# Altium project Main-Board-V1.1.PrjPcb (part 3 of 3)
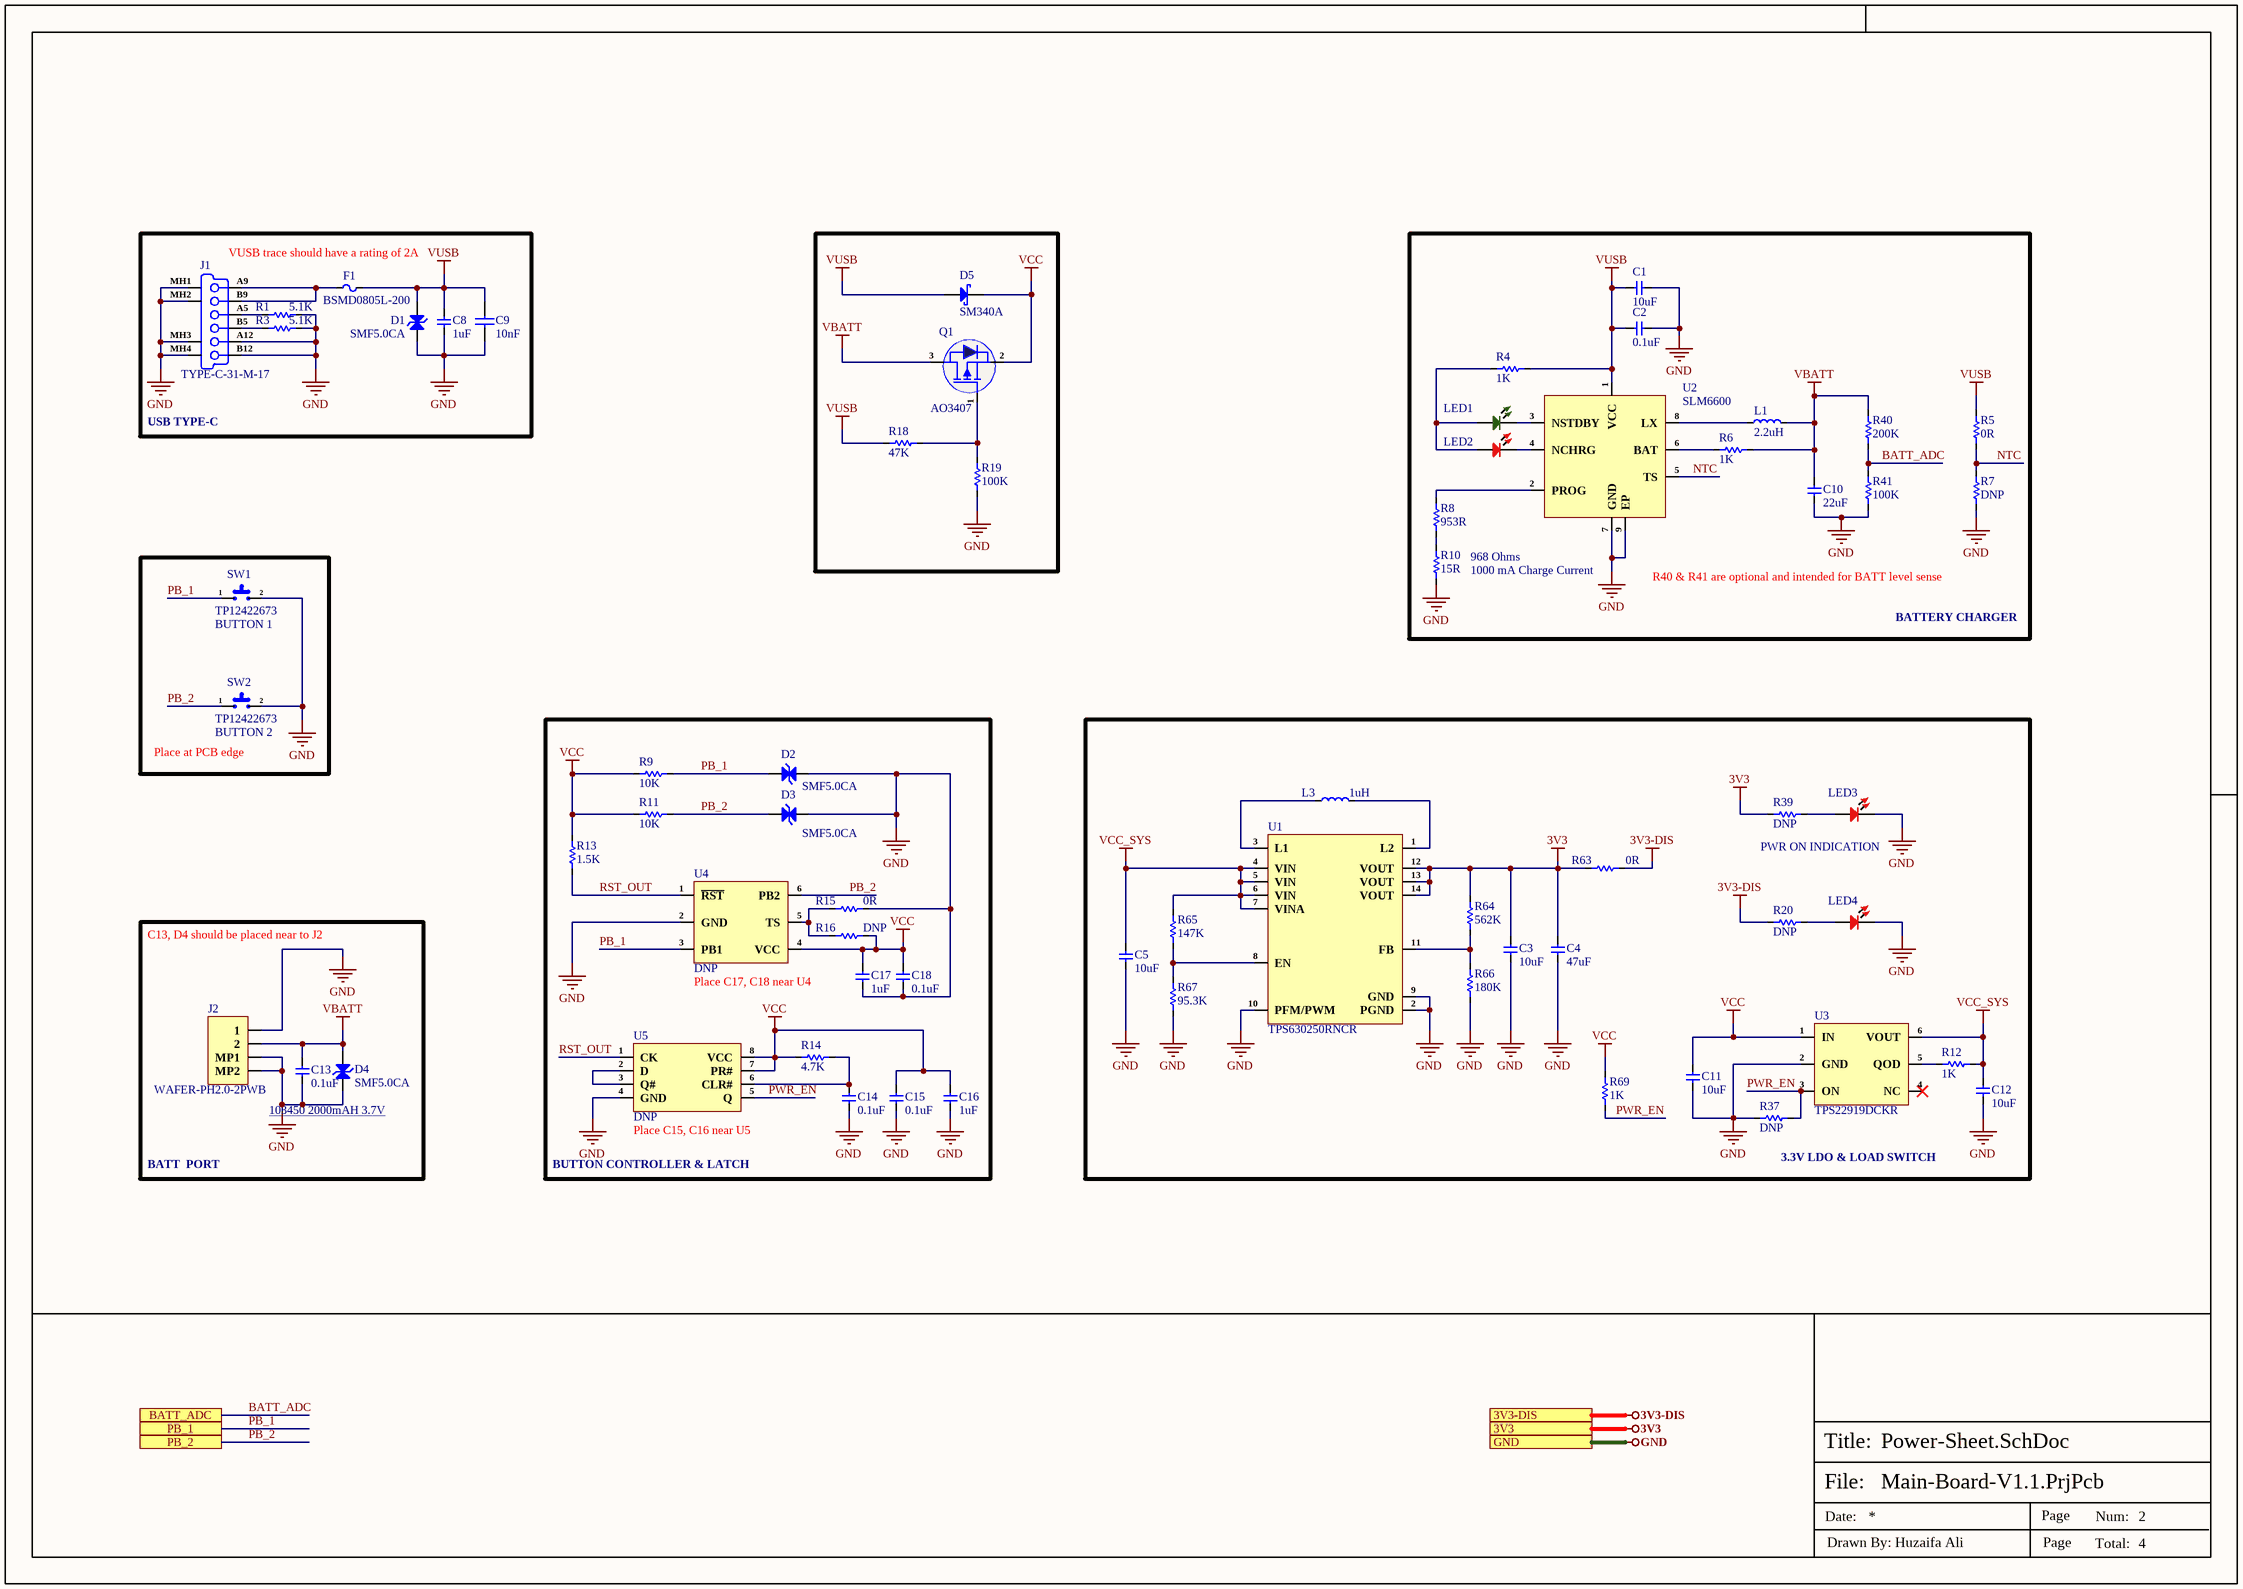
[diagram p5: Power-Sheet.SchDoc]

## Sheet Power-Sheet.SchDoc (continued)

### Library data of the parts (continued)
U3 = TPS22919DCKR: 5.5V 1.5A 90mΩ Controlled Rise Time Self-Protecting Load Switch; Manufacturer: Texas Instruments; Item Type: IC; Fall Time: 10us; Min Supply Voltage: 1.6V; Nominal Supply Current: 8uA; Number of Drivers: 1NUMBER; Rise Time: 750us; Turn-Off Delay Time: 6us; Turn-On Delay Time: 1.5ms; Supplier: Digikey; LCSC Part Number: C2149796; Manufacturer Part Number: TPS22919DCKR; RoHS: Yes; Stock: 134665; Pricing: 1=0.18, 10=0.122, 25=0.1072, 100=0.0911, 250=0.08344, 500=0.07882, 1000=0.07503 (USD); Pins: 6NUMBER; Max Supply Voltage: 5.5V; Output Current: 1.5A; Length: 2mm; Width: 1.25mm; Height: 1.1mm; Thickness: 900um; ComponentLink1URL: http://www.ti.com/general/docs/suppproductinfo.tsp?distId=10&amp;gotoUrl=http%3A%2F%2Fwww.ti.com%2Flit%2Fgpn%2Ftps22919&src-supplier=Digikey; ComponentLink1Description: http://www.ti.com/general/docs/suppproductinfo.tsp?distId=10&amp;gotoUrl=http%3A%2F%2Fwww.ti.com%2Flit%2Fgpn%2Ftps22919&src-supplier=Digikey
U4 = TPS3421EGDRYR: IC SUPERVISOR 2 CHANNEL 6SON; Manufacturer: Texas Instruments; Supplier: Digikey; LCSC Part Number: C361167; Manufacturer Part Number: TPS3421EGDRYR; RoHS: Yes; Item Type: IC; Stock: 11931; Pricing: 1=1.12, 10=0.811, 25=0.7332, 100=0.6475, 250=0.6066, 500=0.58194, 1000=0.56164, 2500=0.5402 (USD); ComponentLink1URL: http://components.arrow.com/part/dataview/56191445S506834N7713?src-supplier=Arrow+Electronics; ComponentLink1Description: http://components.arrow.com/part/dataview/56191445S506834N7713?src-supplier=Arrow+Electronics; ComponentLink2URL: http://www.ti.com/lit/gpn/tps3421?src-supplier=Mouser; ComponentLink2Description: http://www.ti.com/lit/gpn/tps3421?src-supplier=Mouser; ComponentLink3URL: http://www.ti.com/lit/ds/symlink/tps3420.pdf?src-supplier=Digikey; ComponentLink3Description: http://www.ti.com/lit/ds/symlink/tps3420.pdf?src-supplier=Digikey; ComponentLink4URL: http://www.ti.com/general/docs/suppproductinfo.tsp?distId=10&amp;gotoUrl=http%3A%2F%2Fwww.ti.com%2Flit%2Fgpn%2Ftps3420&src-supplier=Digikey; ComponentLink4Description: http://www.ti.com/general/docs/suppproductinfo.tsp?distId=10&amp;gotoUrl=http%3A%2F%2Fwww.ti.com%2Flit%2Fgpn%2Ftps3420&src-supplier=Digikey; ComponentLink5URL: http://www.ti.com/general/docs/lit/getliterature.tsp?genericPartNumber=TPS3422&&fileType=pdf&src-supplier=Avnet; ComponentLink5Description: http://www.ti.com/general/docs/lit/getliterature.tsp?genericPartNumber=TPS3422&&fileType=pdf&src-supplier=Avnet
U5 = NC7SZ74K8X: IC FF D-TYPE SNGL 1BIT US8; Manufacturer: ON Semiconductor / Fairchild; Number of Channels: 1NUMBER; Number of Outputs: 2NUMBER; Supplier: Digikey; LCSC Part Number: C128370; Manufacturer Part Number: NC7SZ74K8X; RoHS: Yes; Item Type: IC; Stock: 98; Pricing: 1=0.71, 10=0.427, 25=0.352, 100=0.2668, 250=0.22504, 500=0.1993, 1000=0.17774 (USD); Number of Inputs: 1NUMBER; Lead Free: 5697LeadFree; ComponentLink1URL: https://datasheet.ciiva.com/34301/1022228-34301883.pdf?src-supplier=Jameco; ComponentLink1Description: https://datasheet.ciiva.com/34301/1022228-34301883.pdf?src-supplier=Jameco; ComponentLink2URL: https://datasheet.ciiva.com/15091/getdatasheetpartid-93111-15091349.pdf?src-supplier=Verical; ComponentLink2Description: https://datasheet.ciiva.com/15091/getdatasheetpartid-93111-15091349.pdf?src-supplier=Verical; ComponentLink3URL: https://datasheet.ciiva.com/5701/1727525-5701664.pdf?src-supplier=Farnell; ComponentLink3Description: https://datasheet.ciiva.com/5701/1727525-5701664.pdf?src-supplier=Farnell; ComponentLink4URL: https://datasheet.ciiva.com/8250/nc7sz74-8250464.pdf?src-supplier=Avnet; ComponentLink4Description: https://datasheet.ciiva.com/8250/nc7sz74-8250464.pdf?src-supplier=Avnet; ComponentLink5URL: https://datasheet.ciiva.com/4812/nc7sz74-116462-4812418.pdf?src-supplier=Mouser; ComponentLink5Description: https://datasheet.ciiva.com/4812/nc7sz74-116462-4812418.pdf?src-supplier=Mouser; ComponentLink6URL: https://datasheet.ciiva.com/1856/nc7sz74-1856933.pdf?src-supplier=Digikey; ComponentLink6Description: https://datasheet.ciiva.com/1856/nc7sz74-1856933.pdf?src-supplier=Digikey; ComponentLink7URL: https://datasheet.ciiva.com/1856/nc7sz74-1856934.pdf?src-supplier=Digikey; ComponentLink7Description: https://datasheet.ciiva.com/1856/nc7sz74-1856934.pdf?src-supplier=Digikey; ComponentLink8URL: https://datasheet.ciiva.com/1856/nc7sz74-1856935.pdf?src-supplier=Digikey; ComponentLink8Description: https://datasheet.ciiva.com/1856/nc7sz74-1856935.pdf?src-supplier=Digikey; ComponentLink9URL: https://datasheet.ciiva.com/28416/1727525-28416494.pdf?src-supplier=Element14; ComponentLink9Description: https://datasheet.ciiva.com/28416/1727525-28416494.pdf?src-supplier=Element14; ComponentLink10URL: https://datasheet.ciiva.com/7970/1727525-7970733.pdf?src-supplier=Element14; ComponentLink10Description: https://datasheet.ciiva.com/7970/1727525-7970733.pdf?src-supplier=Element14; ComponentLink11URL: https://datasheet.ciiva.com/7970/1727525-7970734.pdf?src-supplier=Element14; ComponentLink11Description: https://datasheet.ciiva.com/7970/1727525-7970734.pdf?src-supplier=Element14; ComponentLink12URL: https://datasheet.ciiva.com/7970/1727525-7970735.pdf?src-supplier=Element14; ComponentLink12Description: https://datasheet.ciiva.com/7970/1727525-7970735.pdf?src-supplier=Element14; ComponentLink13URL: https://datasheet.ciiva.com/16740/nc7sz74-16740983.pdf?src-supplier=Future+Electronics; ComponentLink13Description: https://datasheet.ciiva.com/16740/nc7sz74-16740983.pdf?src-supplier=Future+Electronics; ComponentLink14URL: https://datasheet.ciiva.com/48704/001253503-da-01-en-ic-d-type-pos-trg-nc7sz74k8x-vfsop-8-fsc-48704778.pdf?src-supplier=Conrad; ComponentLink14Description: https://datasheet.ciiva.com/48704/001253503-da-01-en-ic-d-type-pos-trg-nc7sz74k8x-vfsop-8-fsc-48704778.pdf?src-supplier=Conrad

## Sheet Screen-Controller-Sheet.SchDoc
size 420 x 297 mm; SheetNumber: 4; SheetTotal: 4
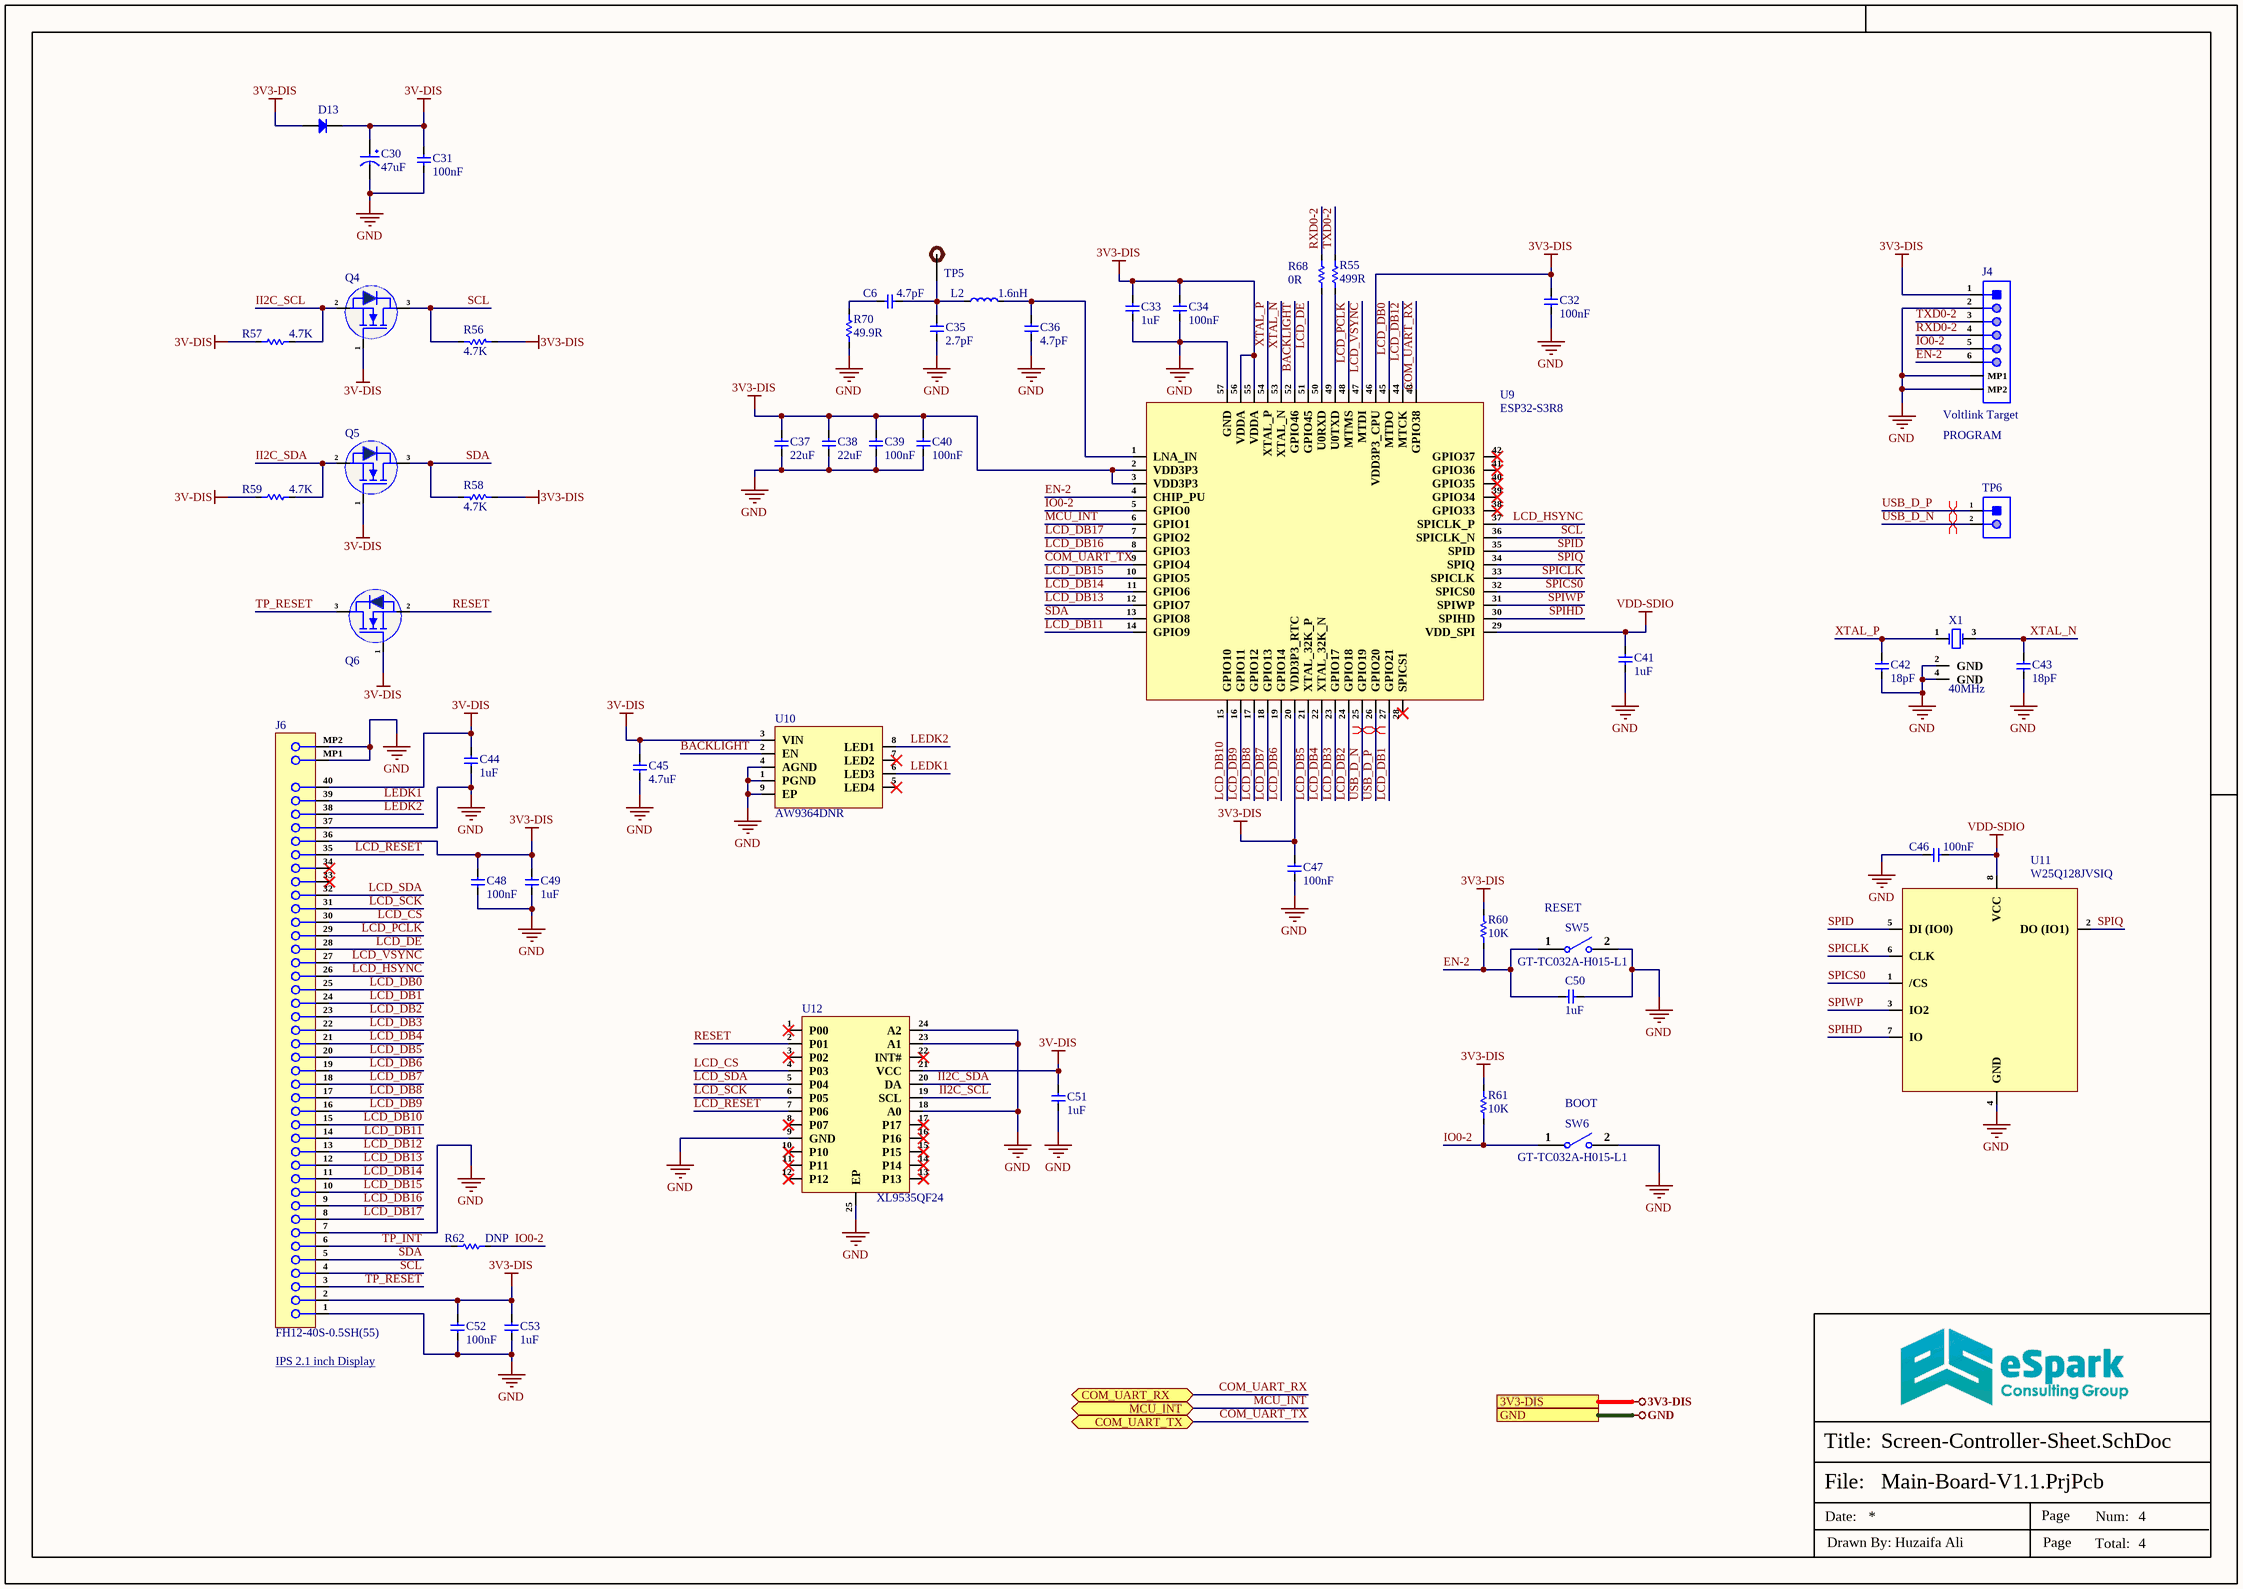
[diagram p3: Screen-Controller-Sheet.SchDoc]

### Parts
C6  4.7pF  [CAP-0201]
C30  47uF  [Tant-1206]
C31  100nF  [Cap-0402]
C32  100nF  [Cap-0402]
C33  1uF  [Cap-0402]
C34  100nF  [Cap-0402]
C35  2.7pF  [CAP-0201]
C36  4.7pF  [CAP-0201]
C37  22uF  [Cap-0603]
C38  22uF  [Cap-0603]
C39  100nF  [Cap-0402]
C40  100nF  [Cap-0402]
C41  1uF  [Cap-0402]
C42  18pF  [Cap-0402]
C43  18pF  [Cap-0402]
C44  1uF  [Cap-0402]
C45  4.7uF  [Cap-0402]
C46  100nF  [Cap-0402]
C47  100nF  [Cap-0402]
C48  100nF  [Cap-0402]
C49  1uF  [Cap-0402]
C50  1uF  [Cap-0402]
C51  1uF  [Cap-0402]
C52  100nF  [Cap-0402]
C53  1uF  [Cap-0402]
D13  1N4148W-7-F  [SOD-123]  (value not drawn)
J4  Voltlink Target  [Voltlink Target]
J6  FH12-40S-0.5SH(55)  [FH12-40S-0.5SH(55)]
L2  1.6nH  [IND-0201]
Q4  BSS123  [SOT-23]  (value not drawn)
Q5  BSS123  [SOT-23]  (value not drawn)
Q6  BSS123  [SOT-23]  (value not drawn)
R55  499R  [Res-0402]
R56  4.7K  [Res-0402]
R57  4.7K  [Res-0402]
R58  4.7K  [Res-0402]
R59  4.7K  [Res-0402]
R60  10K  [Res-0402]
R61  10K  [Res-0402]
R62  DNP  [Res-0603]  (no BOM)
R68  0R  [Res-0402]
R70  49.9R  [Res-0603]
SW5  GT-TC032A-H015-L1  [GT-TC032A-H015-L1]
SW6  GT-TC032A-H015-L1  [GT-TC032A-H015-L1]
TP5  0.5mm Test Pad  [0.5mm Test Pad]  (value not drawn)  (no BOM)
TP6  2 Test Pad  [2 Test Pad]  (value not drawn)  (no BOM)
U9  ESP32-S3R8  [56-QFN (7x7)]
U10  AW9364DNR  [DFN-8-EP(2x2)]
U11  W25Q128JVSIQ  [SOIC-8 (208 mil)]
U12  XL9535QF24  [QFN-24(4x4)]
X1  40MHz  [X322540MPB4SI_]

### Ports
3V3-DIS (see Top_Sheet[5B], Power-Sheet[4D]), COM_UART_RX (bidir, see Top_Sheet[5B], Controller-Sheet[2D]), COM_UART_TX (bidir, see Top_Sheet[5B], Controller-Sheet[2D]), GND (see Top_Sheet[5B], Controller-Sheet[4D], Power-Sheet[4D]), MCU_INT (bidir, see Top_Sheet[5B], Controller-Sheet[2D])

### Nets
3V3-DIS: C32.2 C33.2 C34.2 C37.2 C38.2 C39.2 C40.2 C47.2 C48.2 C49.2 C52.2 C53.2 D13.1(A) J4.1 J6.2 J6.36 R56.1 R58.1 R60.2 R61.2 U9.2(VDD3P3) U9.3(VDD3P3) U9.20(VDD3P3_RTC) U9.46(VDD3P3_CPU) U9.55(VDDA) U9.56(VDDA) ; port 3V3-DIS
3V-DIS: C30.1 C31.2 C44.2 C45.2 C51.2 D13.2(K) J6.40 Q4.1(G) Q5.1(G) Q6.1(G) R57.1 R59.1 U10.3(VIN) U12.21(VCC)
GND: C30.2 C31.1 C32.1 C33.1 C34.1 C35.1 C36.1 C37.1 C38.1 C39.1 C40.1 C41.1 C42.1 C43.1 C44.1 C45.1 C46.2 C47.1 C48.1 C49.1 C50.2 C51.1 C52.1 C53.1 J4.2 J4.MP1 J4.MP2 J6.1 J6.7 J6.37 J6.MP1 J6.MP2 R70.1 SW5.2 SW6.2 U9.57(GND) U10.1(PGND) U10.4(AGND) U10.9(EP) U11.4(GND) U12.9(GND) U12.18(A0) U12.23(A1) U12.24(A2) U12.25(EP) X1.2(GND) X1.4(GND) ; port GND
VDD-SDIO: C41.2 C46.1 U9.29(VDD_SPI) U11.8(VCC)
BACKLIGHT: U9.52(GPIO46) U10.2(EN)
COM_UART_RX: U9.43(GPIO38) ; port COM_UART_RX
COM_UART_TX: U9.9(GPIO4) ; port COM_UART_TX
EN-2: C50.1 J4.6 R60.1 SW5.1 U9.4(CHIP_PU)
II2C_SCL: Q4.2(S) R57.2 U12.19(SCL)
II2C_SDA: Q5.2(S) R59.2 U12.20(DA)
IO0-2: J4.5 R61.1 R62.2 SW6.1 U9.5(GPIO0)
LCD_CS: J6.30 U12.4(P03)
LCD_DB0: J6.25 U9.45(MTDO)
LCD_DB1: J6.24 U9.27(GPIO21)
LCD_DB2: J6.23 U9.24(GPIO18)
LCD_DB3: J6.22 U9.23(GPIO17)
LCD_DB4: J6.21 U9.22(XTAL_32K_N)
LCD_DB5: J6.20 U9.21(XTAL_32K_P)
LCD_DB6: J6.19 U9.19(GPIO14)
LCD_DB7: J6.18 U9.18(GPIO13)
LCD_DB8: J6.17 U9.17(GPIO12)
LCD_DB9: J6.16 U9.16(GPIO11)
LCD_DB10: J6.15 U9.15(GPIO10)
LCD_DB11: J6.14 U9.14(GPIO9)
LCD_DB12: J6.13 U9.44(MTCK)
LCD_DB13: J6.12 U9.12(GPIO7)
LCD_DB14: J6.11 U9.11(GPIO6)
LCD_DB15: J6.10 U9.10(GPIO5)
LCD_DB16: J6.9 U9.8(GPIO3)
LCD_DB17: J6.8 U9.7(GPIO2)
LCD_DE: J6.28 U9.51(GPIO45)
LCD_HSYNC: J6.26 U9.37(SPICLK_P)
LCD_PCLK: J6.29 U9.48(MTMS)
LCD_RESET: J6.35 U12.7(P06)
LCD_SCK: J6.31 U12.6(P05)
LCD_SDA: J6.32 U12.5(P04)
LCD_VSYNC: J6.27 U9.47(MTDI)
LEDK1: J6.39 U10.6(LED3)
LEDK2: J6.38 U10.8(LED1)
MCU_INT: U9.6(GPIO1) ; port MCU_INT
RESET: Q6.2(S) U12.2(P01)
RXD0-2: J4.4 R68.2
SCL: J6.4 Q4.3(D) R56.2 U9.36(SPICLK_N)
SDA: J6.5 Q5.3(D) R58.2 U9.13(GPIO8)
SPICLK: U9.33(SPICLK) U11.6(CLK)
SPICS0: U9.32(SPICS0) U11.1(/CS)
SPID: U9.35(SPID) U11.5(DI_(IO0))
SPIHD: U9.30(SPIHD) U11.7(IO)
SPIQ: U9.34(SPIQ) U11.2(DO_(IO1))
SPIWP: U9.31(SPIWP) U11.3(IO2)
TP_INT: J6.6 R62.1
TP_RESET: J6.3 Q6.3(D)
TXD0-2: J4.3 R55.2
USB_D_N: TP6.2 U9.25(GPIO19)
USB_D_P: TP6.1 U9.26(GPIO20)
XTAL_N: C43.2 U9.53(XTAL_N) X1.3(CRYSTAL)
XTAL_P: C42.2 U9.54(XTAL_P) X1.1(CRYSTAL)
NetC6_1: C6.1 C35.2 L2.1 TP5.1
NetC6_2: C6.2 R70.2
NetC36_2: C36.2 L2.2 U9.1(LNA_IN)
NetR55_1: R55.1 U9.49(U0TXD)
NetR68_1: R68.1 U9.50(U0RXD)

Not connected (* = marked no-connect by the designer): J6 33* 34*; U9 28(SPICS1)* 38(GPIO33)* 39(GPIO34)* 40(GPIO35)* 41(GPIO36)* 42(GPIO37)*; U10 5(LED4)* 7(LED2)*; U12 1(P00)* 3(P02)* 8(P07)* 10(P10)* 11(P11)* 12(P12)* 13(P13)* 14(P14)* 15(P15)* 16(P16)* 17(P17)* 22(INT#)*

### Layout directives
differential pair: USB_D_N, USB_D_P

### Notes on the sheet
- (near J4) PROGRAM
- (near SW5) RESET
- (near SW6) BOOT
- IPS 2.1 inch Display <https://vi.aliexpress.com/item/32562780346.html>
- File:
- Title:
- Date:
- Page
- Num:
- Total:
- Drawn By: Huzaifa Ali

### Library data of the parts
C6 C36 = CC0201BRNPO9BN4R7: CAP CER 4.7PF 50V C0G/NPO 0201; Manufacturer: Yageo; Item Type: Capacitor; Supplier: Arrow Electronics; Supplier Part Number: CC0201BRNPO9BN4R7; Manufacturer Part Number: CC0201BRNPO9BN4R7; RoHS: Yes; Category: Ceramic Capacitors; Stock: 210000; Pricing: 15000=0.0023 (USD); Mounting Technology: Surface Mount; Case/Package: 0201; Min Operating Temperature: -55°C; Max Operating Temperature: 125°C; Packaging: Tape and Reel; Value: 4.7pF; Voltage Rating: 50V; Series: CC; Length: 0.024inch; Width: 0.012inch; Thickness: 0.013inch; RoHS Compliant: Yes; ComponentLink1URL: https://www.yageo.com/upload/media/product/productsearch/datasheet/mlcc/UPY-GP_NP0_16V-to-50V_18.pdf?src-supplier=Digi-Key; ComponentLink1Description: https://www.yageo.com/upload/media/product/productsearch/datasheet/mlcc/UPY-GP_NP0_16V-to-50V_18.pdf?src-supplier=Digi-Key; ComponentLink2URL: http://www.yageo.com/documents/recent/UPY-GP_NP0_16V-to-50V_16.pdf?src-supplier=Digi-Key; ComponentLink2Description: http://www.yageo.com/documents/recent/UPY-GP_NP0_16V-to-50V_16.pdf?src-supplier=Digi-Key; LCSC Part Number: C505471
C30 = TMCMA1A476MTRF: CAP TANT 47UF 20% 10V 1206; Manufacturer: Vishay Sprague; Item Type: Capacitors; ESR (Equivalent Series Resistance): 2.6R; Leakage Current: 9.4uA; Ripple Current: 173mA; Supplier: Mouser; LCSC Part Number: C4984790; Manufacturer Part Number: TMCMA1A476MTRF; RoHS: Yes; Stock: 7380; Pricing: 1=0.44, 10=0.271, 50=0.271, 100=0.175, 1000=0.146, 10000=0.119 (USD); Mounting Technology: Surface Mount; Case/Package: 1206; Case Code (Metric): 3216; Case Code (Imperial): 1206; Weight: 0.000571oz; Min Operating Temperature: -55°C; Max Operating Temperature: 125°C; Packaging: Tape and Reel; Tolerance: 20%; Termination: SMD/SMT; Package Quantity: 2000; Series: TMCM; Voltage Rating: 10V; Dissipation Factor: 20%; Voltage Rating (DC): 10V; Value: 47uF; Length: 3.2mm; Width: 1.6mm; Height: 1.8mm; RoHS Compliant: Yes; Reach SVHC Compliant: Unknown; ComponentLink1URL: http://www.farnell.com/datasheets/1948250.pdf?src-supplier=Farnell; ComponentLink1Description: http://www.farnell.com/datasheets/1948250.pdf?src-supplier=Farnell; ComponentLink2URL: http://www.mouser.com/ds/2/427/tmcm-515668.pdf?src-supplier=Mouser; ComponentLink2Description: http://www.mouser.com/ds/2/427/tmcm-515668.pdf?src-supplier=Mouser; ComponentLink3URL: http://www.farnell.com/datasheets/2245108.pdf?src-supplier=Farnell; ComponentLink3Description: http://www.farnell.com/datasheets/2245108.pdf?src-supplier=Farnell; ComponentLink4URL: http://www.farnell.com/datasheets/1948250.pdf?src-supplier=Element14; ComponentLink4Description: http://www.farnell.com/datasheets/1948250.pdf?src-supplier=Element14; ComponentLink5URL: http://www.vishay.com/docs/40178/tmcm.pdf?src-supplier=Avnet; ComponentLink5Description: http://www.vishay.com/docs/40178/tmcm.pdf?src-supplier=Avnet
C31 C32 C34 C39 C40 C46-C48 C52 = CC0402KRX5R8BB104: CAP CER 0.1UF 25V X5R 0402; Manufacturer: Yageo; Tolerance: 10%; Item Type: Capacitor; Supplier 1: Digi-Key; Manufacturer Part Number: CC0402KRX5R8BB104; RoHS: Yes; Category: Ceramic Capacitors; Stock 1: 4598218; Pricing 1: 1=0.10000, 10=0.03800, 50=0.02100, 100=0.01710, 500=0.01224, 1000=0.00961, 2500=0.00874, 5000=0.00804 (USD); Mount: Surface Mount; Case/Package: 0402; Case Code (Metric): 1005; Case Code (Imperial): 0402; Min Operating Temperature: -55°C; Max Operating Temperature: 85°C; Voltage Rating: 25V; Packaging: Tape and Reel; Capacitance: 100nF; Voltage Rating (DC): 25V; Dielectric: X5R; Resistor Type: Ceramic; Series: CC; Length: 0.039inch; Width: 0.02inch; Thickness: 0.022inch; Depth: 0.5mm; Lead Free: Lead Free; Halogen Free: Halogen Free; RoHS Compliant: Yes; ComponentLink1URL: http://www.mouser.com/ds/2/447/UPY-GPHC_X5R_4V-to-50V_25-1131599.pdf?src-supplier=Mouser; ComponentLink1Description: http://www.mouser.com/ds/2/447/UPY-GPHC_X5R_4V-to-50V_25-1131599.pdf?src-supplier=Mouser; ComponentLink2URL: http://www.yageo.com/documents/recent/UPY-GPHC_X5R_4V-to-50V-16.pdf?src-supplier=Future+Electronics; ComponentLink2Description: http://www.yageo.com/documents/recent/UPY-GPHC_X5R_4V-to-50V-16.pdf?src-supplier=Future+Electronics; ComponentLink3URL: http://www.yageo.com/documents/recent/UPY-GPHC_X5R_4V-to-50V_25.pdf?src-supplier=Digi-Key; ComponentLink3Description: http://www.yageo.com/documents/recent/UPY-GPHC_X5R_4V-to-50V_25.pdf?src-supplier=Digi-Key; Supplier Part Number 1: 311-1697-1-ND; LCSC Part Number: C106256
C33 C41 C44 C49-C51 C53 = GRM155C71C105KE11D: CAP CER 1UF 16V X7S 0402; Manufacturer: Murata; Item Type: Capacitors; Material: 4241ConductorMaterial; Tolerance: 10%; Dielectric: 1542DielectricType; Supplier: Mouser; LCSC Part Number: C576449; Manufacturer Part Number: GRM155C71C105KE11D; RoHS: No; Stock: 16102; Pricing: 1=0.11, 10=0.041, 50=0.041, 100=0.026, 1000=0.023, 10000=0.016 (USD); Case/Package: 343Case; Min Operating Temperature: -55°C; Max Operating Temperature: 125°C; Value: 1uF; Voltage Rating: 16V; Voltage Rating (DC): 16V; Length: 1mm; Width: 500um; Height: 600um; Thickness: 500um
C35 = CC0201CRNPO9BN2R7: CAP CER 2.7PF 50V C0G/NPO 0201; Manufacturer: Yageo; Dielectric: C0G; Item Type: Capacitor; Supplier: Avnet; Supplier Part Number: CC0201CRNPO9BN2R7; Manufacturer Part Number: CC0201CRNPO9BN2R7; RoHS: Yes; Category: Ceramic Capacitors; Stock: 15000; Pricing: 15000=0.0017 (USD); Mounting Technology: Surface Mount; Case/Package: 0201; Case Code (Imperial): 0201; Case Code (Metric): 0603; Weight: 6E-06oz; Min Operating Temperature: -55°C; Max Operating Temperature: 125°C; Value: 2.7pF; Packaging: Tape and Reel; Voltage Rating (DC): 50V; Voltage Rating: 50V; Termination: SMD/SMT; Series: CC; Length: 0.024inch; Width: 0.012inch; Thickness: 0.013inch; RoHS Compliant: Yes; ComponentLink1URL: https://datasheet.ciiva.com/13208/upy-gp-np0-16v-to-50v-8-13208314.pdf?src-supplier=Mouser; ComponentLink1Description: https://datasheet.ciiva.com/13208/upy-gp-np0-16v-to-50v-8-13208314.pdf?src-supplier=Mouser; LCSC Part Number: C325439
C37 C38 = CC0603MRX5R6BB226: CAP CER 22UF 10V X5R 0603; Manufacturer: Yageo; Tolerance: 20%; Item Type: Capacitor; Supplier 1: Digi-Key; Manufacturer Part Number: CC0603MRX5R6BB226; RoHS: Yes; Category: Ceramic Capacitors; Stock 1: 19628; Pricing 1: 1=0.68000, 10=0.48000, 50=0.36300, 100=0.31610, 500=0.23416, 1000=0.19903 (USD); Mount: Surface Mount; Case/Package: 0603; Case Code (Metric): 1608; Case Code (Imperial): 0603; Weight: 7.1E-05oz; Min Operating Temperature: -55°C; Max Operating Temperature: 85°C; Packaging: Tape and Reel; Capacitance: 22uF; Voltage Rating: 10V; Dielectric: X5R; Termination: SMD/SMT; Voltage Rating (DC): 10V; Package Quantity: 4000; Length: 0.063inch; Width: 0.8mm; Height: 0.8mm; Thickness: 0.035inch; Lead Free: Lead Free; Halogen Free: Halogen Free; RoHS Compliant: Yes; ComponentLink1URL: http://www.mouser.com/ds/2/447/Yageo_UPY-GP_NP0_16V-to-50V_9-358835.pdf?src-supplier=Mouser; ComponentLink1Description: http://www.mouser.com/ds/2/447/Yageo_UPY-GP_NP0_16V-to-50V_9-358835.pdf?src-supplier=Mouser; ComponentLink2URL: http://www.yageo.com/documents/recent/UPY-GPHC_X5R_4V-to-50V_25.pdf?src-supplier=Digi-Key; ComponentLink2Description: http://www.yageo.com/documents/recent/UPY-GPHC_X5R_4V-to-50V_25.pdf?src-supplier=Digi-Key; Supplier Part Number 1: 311-1819-1-ND; LCSC Part Number: C109447
C42 C43 = CC0402JRNPO9BN180: CAP CER 18PF 50V C0G/NPO 0402; Manufacturer: Yageo; Item Type: Capacitors; Tolerance: 5%; Dielectric: C0G; Temperature Coefficient: 30ppm/°C; Supplier: Rs; LCSC Part Number: C106202; Manufacturer Part Number: CC0402JRNPO9BN180; RoHS: Yes; Stock: 12000; Mounting Technology: Surface Mount; Case/Package: 0402; Pins: 2; Case Code (Metric): 1005; Case Code (Imperial): 0402; Weight: 2.3E-05oz; Min Operating Temperature: -55°C; Max Operating Temperature: 125°C; Value: 18pF; Voltage Rating: 50V; Packaging: Tape and Reel; Termination: SMD/SMT; Series: CC; Voltage Rating (DC): 50V; Voltage: 50V; Length: 1mm; Width: 0.5mm; Height: 0.5mm; Depth: 0.5mm; Radiation Hardening: No; RoHS Compliant: Yes; Reach SVHC Compliant: No; Lead Free: Lead Free; Halogen Free: 5694HalogenFree; ComponentLink1URL: https://datasheet.ciiva.com/11788/0900766b80d84fbf-11788369.pdf?src-supplier=Rs; ComponentLink1Description: https://datasheet.ciiva.com/11788/0900766b80d84fbf-11788369.pdf?src-supplier=Rs; ComponentLink2URL: https://datasheet.ciiva.com/28450/1443161-28450232.pdf?src-supplier=Element14; ComponentLink2Description: https://datasheet.ciiva.com/28450/1443161-28450232.pdf?src-supplier=Element14; ComponentLink3URL: https://datasheet.ciiva.com/176/mlccorderingcode-176358.pdf?src-supplier=Digikey; ComponentLink3Description: https://datasheet.ciiva.com/176/mlccorderingcode-176358.pdf?src-supplier=Digikey; ComponentLink4URL: https://datasheet.ciiva.com/176/mlccorderingcode-176357.pdf?src-supplier=Digikey; ComponentLink4Description: https://datasheet.ciiva.com/176/mlccorderingcode-176357.pdf?src-supplier=Digikey; ComponentLink5URL: https://datasheet.ciiva.com/176/mlccorderingcode-176359.pdf?src-supplier=Digikey; ComponentLink5Description: https://datasheet.ciiva.com/176/mlccorderingcode-176359.pdf?src-supplier=Digikey; ComponentLink6URL: https://datasheet.ciiva.com/13208/upy-gp-np0-16v-to-50v-8-13208430.pdf?src-supplier=Mouser; ComponentLink6Description: https://datasheet.ciiva.com/13208/upy-gp-np0-16v-to-50v-8-13208430.pdf?src-supplier=Mouser; ComponentLink7URL: https://datasheet.ciiva.com/11587/upy-gp-np0-16v-to-50v-8-11587087.pdf?src-supplier=Avnet; ComponentLink7Description: https://datasheet.ciiva.com/11587/upy-gp-np0-16v-to-50v-8-11587087.pdf?src-supplier=Avnet
C45 = CC0402KRX5R6BB475: CAP CER 4.7UF 10V X5R 0402; Manufacturer: Yageo; Tolerance: 10%; Supplier 1: Farnell; Manufacturer Part Number: CC0402KRX5R6BB475; RoHS: Yes; Category: Ceramic Capacitors; Stock 1: 20000; Pricing 1: 10000=0.02310, 50000=0.02100 (GBP); Mount: Surface Mount; Case/Package: 0402; Case Code (Imperial): 0402; Case Code (Metric): 1005; Min Operating Temperature: -55°C; Max Operating Temperature: 85°C; Packaging: Cut Tape; Capacitance: 4.7uF; Voltage Rating: 10V; RoHS Compliant: Yes; ComponentLink1URL: http://www.yageo.com/documents/recent/UPY-GPHC_X5R_4V-to-50V_25.pdf?src-supplier=Digi-Key; ComponentLink1Description: http://www.yageo.com/documents/recent/UPY-GPHC_X5R_4V-to-50V_25.pdf?src-supplier=Digi-Key; Supplier Part Number 1: 3871698; LCSC Part Number: C326586
D13 = 1N4148W-7-F: DIODE GEN PURP 100V 300MA SOD123; Manufacturer: Diodes; Forward Current: 150mA; Reverse Recovery Time: 4ns; Max Forward Surge Current (Ifsm): 2A; Element Configuration: Single; Max Reverse Current: 1uA; Forward Voltage: 1.25V; Power Dissipation: 400mW; Polarity: Standard; Voltage Rating (DC): 75V; Value: 2pF; Supplier 1: Future Electronics; Manufacturer Part Number: 1N4148W-7-F; RoHS: Yes; Category: Rectifier Diodes; Stock 1: 32931000; Pricing 1: 3000=0.01840, 12000=0.01760, 45000=0.01690, 120000=0.01640, 300000=0.01560 (USD); Mounting Technology: Surface Mount; Pins: 2; Weight: 0.000353oz; Contact Plating: Tin,Matte; Min Operating Temperature: -65°C; Max Operating Temperature: 150°C; Packaging: Tape and Reel; Max Repetitive Reverse Voltage (Vrrm): 100V; Peak Non-Repetitive Surge Current: 2A; Voltage: 100V; Max Surge Current: 2A; Package Quantity: 3000; Recovery Time: 4ns; Average Rectified Current: 300mA; Power Rating: 400mW; Current Rating: 150mA; Output Current: 150mA; Max Reverse Voltage (DC): 100V; Series: -; Reverse Recovery Time-Max: 4ns; Length: 2.85mm; Width: 1.7mm; Height: 1.25mm; Radiation Hardening: No; RoHS Compliant: Yes; Reach SVHC Compliant: Yes; Lead Free: Lead Free; ComponentLink1URL: https://datasheet.ciiva.com/1179/1915529-1179304.pdf?src-supplier=Element14; ComponentLink1Description: https://datasheet.ciiva.com/1179/1915529-1179304.pdf?src-supplier=Element14; ComponentLink2URL: https://datasheet.ciiva.com/22695/1915529-22695239.pdf?src-supplier=Element14; ComponentLink2Description: https://datasheet.ciiva.com/22695/1915529-22695239.pdf?src-supplier=Element14; ComponentLink3URL: https://datasheet.ciiva.com/8300/ds30086-8300392.pdf?src-supplier=Avnet; ComponentLink3Description: https://datasheet.ciiva.com/8300/ds30086-8300392.pdf?src-supplier=Avnet; ComponentLink4URL: https://datasheet.ciiva.com/15219/getdatasheetpartid-110030-15219548.pdf?src-supplier=Verical; ComponentLink4Description: https://datasheet.ciiva.com/15219/getdatasheetpartid-110030-15219548.pdf?src-supplier=Verical; ComponentLink5URL: https://datasheet.ciiva.com/8303/ds30086-8303197.pdf?src-supplier=Avnet; ComponentLink5Description: https://datasheet.ciiva.com/8303/ds30086-8303197.pdf?src-supplier=Avnet; ComponentLink6URL: https://datasheet.ciiva.com/911/ds30086-911735.pdf?src-supplier=Digi-Key; ComponentLink6Description: https://datasheet.ciiva.com/911/ds30086-911735.pdf?src-supplier=Digi-Key; ComponentLink7URL: https://datasheet.ciiva.com/911/ds30086-911736.pdf?src-supplier=Digi-Key; ComponentLink7Description: https://datasheet.ciiva.com/911/ds30086-911736.pdf?src-supplier=Digi-Key; ComponentLink8URL: https://datasheet.ciiva.com/911/ds30086-911734.pdf?src-supplier=Digi-Key; ComponentLink8Description: https://datasheet.ciiva.com/911/ds30086-911734.pdf?src-supplier=Digi-Key; ComponentLink9URL: https://datasheet.ciiva.com/4435/ds30086-4435128.pdf?src-supplier=Mouser; ComponentLink9Description: https://datasheet.ciiva.com/4435/ds30086-4435128.pdf?src-supplier=Mouser; Supplier Part Number 1: 7634694; LCSC Part Number: C83528; Item Type: Diode
J4 = C145963: 1x6P SH 1 1mm 6 SMD,P=1mm Wire To Board / Wire To Wire Connector ROHS; Manufacturer: BOOMELE; Manufacturer Part Number: C145963; Package: SMD,P=1mm; LCSC Part Number: C145963; Item Type: Connector; ComponentLink1Description: LCSC; ComponentLink1URL: https://www.lcsc.com/product-detail/Wire-To-Board-Wire-To-Wire-Connector_BOOMELE-Boom-Precision-Elec-C145963_C145963.html
J6 = FH12-40S-0.5SH(55): CONN FFC BOTTOM 40POS 0.50MM R/A; Manufacturer: Hirose; Connector Type: CARD EDGE CONNECTOR; Option: General Purpose; Filter Feature: No; Number of Rows Loaded: 1; Number of Contacts: 40; Contact Pattern: RECTANGULAR; Contact Resistance: 50mR; Contact Style: BELLOWED TYPE; Dielectric Withstanding Voltage (AC): 150V; Durability: 20Cycles; Insulation Resistance: 500MR; Rated Current (Signal): 400mA; Body Breadth: 0.079inch; Body Depth: 0.22inch; Body Length: 0.949inch; Mating Contact Pitch: 0.02inch; Mounting Option 1: EJECT LEVER; Mounting Option 2: LOCKING; Reference Standard: UL; Reliability: COMMERCIAL; Item Type: Connector; Supplier 1: Digi-Key; Manufacturer Part Number: FH12-40S-0.5SH(55); RoHS: Yes; Category: FFC / FPC; Stock 1: 11247; Pricing 1: 1=3.00000, 10=2.72800, 25=2.58400, 50=2.52400, 100=2.40380, 250=2.10332, 500=2.04324, 1000=1.74276 (USD); Mounting Technology: Board; Contact Finish - Mating: NOT SPECIFIED; Contact Finish - Termination: Nickel/Gold (Ni/Au); Insulation Color: Beige; Insulation Material: Polyamide; Min Operating Temperature: -40°C; Max Operating Temperature: 70°C; JESD-609 Code: e4; Contact Gender: Female; Mixed Contacts: No; Mounting Style: RIGHT ANGLE; Termination: SMD/SMT; Number Of PCB Rows: 1; PCB Contact Pattern: RECTANGULAR; Terminal Pitch: 0.5mm; Flammability Rating: UL94 V-0; RoHS Compliant: Yes; DIN Conformance: No; IEC Conformance: No; MIL Conformance: No; Reach SVHC Compliant: Yes; ComponentLink1URL: https://datasheet.ciiva.com:443/pdfs/VipMasterIC/IC/HIRO/HIRO-S-A0003089604/HIRO-S-A0008599618-1.pdf?src-supplier=IHS+Markit; ComponentLink1Description: https://datasheet.ciiva.com:443/pdfs/VipMasterIC/IC/HIRO/HIRO-S-A0003089604/HIRO-S-A0008599618-1.pdf?src-supplier=IHS+Markit; ComponentLink2URL: https://datasheet.ciiva.com/11745/0900766b80d985fc-11745617.pdf?src-supplier=RSComponents; ComponentLink2Description: https://datasheet.ciiva.com/11745/0900766b80d985fc-11745617.pdf?src-supplier=RSComponents; ComponentLink3URL: https://datasheet.ciiva.com/15176/getdatasheetpartid-432539-15176843.pdf?src-supplier=Verical; ComponentLink3Description: https://datasheet.ciiva.com/15176/getdatasheetpartid-432539-15176843.pdf?src-supplier=Verical; ComponentLink4URL: https://datasheet.ciiva.com/7661/58803-7661389.pdf?src-supplier=Element14; ComponentLink4Description: https://datasheet.ciiva.com/7661/58803-7661389.pdf?src-supplier=Element14; Supplier Part Number 1: 26-FH12-40S-0.5SH(55)CT-ND; LCSC Part Number: C202114
L2 = LQP03HQ1N6B02D: FIXED IND 1.6NH 1A 50 MOHM SMD; Manufacturer: Murata; Core Material: Non-Magnetic; Shielding: Unshielded; DC Resistance (DCR): 50mR; Self Resonant Frequency: 10GHz; Test Frequency: 500MHz; Item Type: Inductor; Supplier: Digi-Key; Supplier Part Number: 490-13883-1-ND; Manufacturer Part Number: LQP03HQ1N6B02D; RoHS: Yes; Category: Fixed Inductors; Stock: 27606; Pricing: 1=0.16, 10=0.145, 25=0.1236, 50=0.109, 100=0.1, 250=0.09088, 500=0.08544, 1000=0.06545, 2500=0.06181 (USD); Mounting Technology: Surface Mount; Case/Package: 0201; Case Code (Imperial): 0201; Case Code (Metric): 0603; Min Operating Temperature: -55°C; Max Operating Temperature: 125°C; Packaging: Cut Tape; Value: 1.6nH; Current Rating: 1A; Series: LQP03; RoHS Compliant: Yes; ComponentLink1URL: http://search.murata.co.jp/Ceramy/image/img/P02/JELF243C-0021.pdf?src-supplier=Digi-Key; ComponentLink1Description: http://search.murata.co.jp/Ceramy/image/img/P02/JELF243C-0021.pdf?src-supplier=Digi-Key; LCSC Part Number: C237384
Q4-Q6 = BSS123: 100V 200mA 300mW 1.06Ω@10V,200mA 3V@250uA N Channel SOT-23 MOSFETs ROHS; Manufacturer: BORN; Item Type: Mosfet; Manufacturer Part Number: BSS123; Package: SOT-23; LCSC Part Number: C431506; ComponentLink1Description: LCSC; ComponentLink1URL: https://www.lcsc.com/product-detail/MOSFETs_BORN-BSS123_C431506.html
R55 = RC0402FR-07499RL: RES 499 OHM 1% 1/16W 0402; Manufacturer: Yageo; Power Rating: 62.5mW; Voltage Rating: 50V; Max Power Dissipation: 63mW; Temperature Coefficient: 100ppm/°C; Supplier 1: Mouser; Manufacturer Part Number: RC0402FR-07499RL; RoHS: Yes; Category: Chip SMD Resistors; Stock 1: 936879; Pricing 1: 1=0.10000, 10=0.01200, 50=0.01200, 100=0.00500, 1000=0.00300, 10000=0.00100 (USD); Case/Package: 0402; Case Code (Metric): 1005; Case Code (Imperial): 0402; Size Code: 0402; Min Operating Temperature: -55°C; Max Operating Temperature: 155°C; Resistance: 499R; Tolerance: 1%; Package Quantity: 1; Packaging: Tape and Reel; Resistor Type: Thick Film; Number of Terminations: 2; Termination: SMD/SMT; Voltage Rating (DC): 50V; Features: Moisture Resistant; Series: RC; Resistance Tolerance: 1%; Construction: Rectangular; Length: 1mm; Width: 0.02inch; Height: 0.016inch; Depth: 0.5mm; RoHS Compliant: Yes; REACH SVHC: No SVHC; Military Standard: Not; Lead Free: Lead Free; ComponentLink1URL: https://datasheet.ciiva.com/2453/pyu-r-int-thick-7-2453539.pdf?src-supplier=Digi-Key; ComponentLink1Description: https://datasheet.ciiva.com/2453/pyu-r-int-thick-7-2453539.pdf?src-supplier=Digi-Key; ComponentLink2URL: https://datasheet.ciiva.com/2453/pyu-r-int-thick-7-2453540.pdf?src-supplier=Digi-Key; ComponentLink2Description: https://datasheet.ciiva.com/2453/pyu-r-int-thick-7-2453540.pdf?src-supplier=Digi-Key; ComponentLink3URL: https://datasheet.ciiva.com/2453/pyu-r-int-thick-7-2453538.pdf?src-supplier=Digi-Key; ComponentLink3Description: https://datasheet.ciiva.com/2453/pyu-r-int-thick-7-2453538.pdf?src-supplier=Digi-Key; Supplier Part Number 1: 603-RC0402FR-07499RL; LCSC Part Number: C137970
R56-R59 = RC0402FR-074K7L: RES 4.7K OHM 1% 1/16W 0402; Manufacturer: Yageo; Voltage Rating (DC): 50V; Power Rating: 62.5mW; Resistance: 4.7kR; Temperature Coefficient: 100ppm/°C; Max Power Dissipation: 63mW; Item Type: Resistor; Supplier 1: Avnet; Manufacturer Part Number: RC0402FR-074K7L; RoHS: Yes; Category: Chip SMD Resistors; Stock 1: 2420000; Pricing 1: 10000=0.00085 (USD); Case/Package: 0402; Number of Pins: 2; Case Code (Imperial): 0402; Case Code (Metric): 1005; Size Code: 0402; Min Operating Temperature: -55°C; Max Operating Temperature: 155°C; Tolerance: 1%; Voltage Rating: 50V; Packaging: Tape and Reel; Resistor Type: Thick Film; Termination: SMD/SMT; Features: Moisture Resistant; Series: RC; Number of Terminations: 2; Resistance Tolerance: 1%; Construction: Rectangular; Length: 1mm; Width: 0.5mm; Height: 0.32mm; Depth: 0.5mm; Height - Seated (Max): 0.016inch; RoHS Compliant: Yes; Reach SVHC Compliant: Yes; Military Standard: Not; Lead Free: Lead Free; ComponentLink1URL: https://datasheet.ciiva.com/22661/1686128-22661342.pdf?src-supplier=Element14; ComponentLink1Description: https://datasheet.ciiva.com/22661/1686128-22661342.pdf?src-supplier=Element14; ComponentLink2URL: https://datasheet.ciiva.com/7850/1018594-7850022.pdf?src-supplier=Element14; ComponentLink2Description: https://datasheet.ciiva.com/7850/1018594-7850022.pdf?src-supplier=Element14; ComponentLink3URL: https://datasheet.ciiva.com/7850/1018594-7850023.pdf?src-supplier=Element14; ComponentLink3Description: https://datasheet.ciiva.com/7850/1018594-7850023.pdf?src-supplier=Element14; ComponentLink4URL: https://datasheet.ciiva.com/15215/getdatasheetpartid-328119-15215035.pdf?src-supplier=Verical; ComponentLink4Description: https://datasheet.ciiva.com/15215/getdatasheetpartid-328119-15215035.pdf?src-supplier=Verical; Supplier Part Number 1: RC0402FR-074K7L; LCSC Part Number: C105871
R60 R61 = RC0402FR-0710KL: RES 10K OHM 1% 1/16W 0402; Manufacturer: Yageo; Resistance: 10kR; Voltage Rating (DC): 50V; Temperature Coefficient: 100ppm/°C; Power Rating: 62.5mW; Max Power Dissipation: 63mW; Item Type: Resistor; Supplier 1: Mouser; Manufacturer Part Number: RC0402FR-0710KL; RoHS: Yes; Category: Chip SMD Resistors; Stock 1: 18648329; Pricing 1: 1=0.10000, 10=0.01400, 50=0.01400, 100=0.00500, 1000=0.00300, 10000=0.00200 (USD); Case/Package: 0402; Number of Pins: 2; Case Code (Imperial): 0402; Case Code (Metric): 1005; Min Operating Temperature: -55°C; Max Operating Temperature: 155°C; Resistor Type: Thick Film; Tolerance: 1%; Packaging: Tape and Reel; Voltage Rating: 50V; Termination: SMD/SMT; Working Voltage: 50V; Number of Terminations: 2; Features: Moisture Resistant; Series: RC; Resistance Tolerance: 1%; Construction: Rectangular; Length: 1mm; Width: 0.5mm; Height: 0.32mm; Depth: 0.5mm; Lead Pitch: 0.2mm; REACH SVHC: No SVHC; Lead Free: Lead Free; RoHS Compliant: Yes; Military Standard: Not; ComponentLink1URL: https://datasheet.ciiva.com/7660/38568-7660787.pdf?src-supplier=Element14; ComponentLink1Description: https://datasheet.ciiva.com/7660/38568-7660787.pdf?src-supplier=Element14; ComponentLink2URL: https://datasheet.ciiva.com/7849/1686128-7849814.pdf?src-supplier=Element14; ComponentLink2Description: https://datasheet.ciiva.com/7849/1686128-7849814.pdf?src-supplier=Element14; ComponentLink3URL: https://datasheet.ciiva.com/7983/1018594-7983486.pdf?src-supplier=Element14; ComponentLink3Description: https://datasheet.ciiva.com/7983/1018594-7983486.pdf?src-supplier=Element14; ComponentLink4URL: https://datasheet.ciiva.com/22747/1018594-22747512.pdf?src-supplier=Element14; ComponentLink4Description: https://datasheet.ciiva.com/22747/1018594-22747512.pdf?src-supplier=Element14; ComponentLink5URL: https://datasheet.ciiva.com/12667/pyu-rc0402-51-rohs-l-6-r-12667067.pdf?src-supplier=Mouser; ComponentLink5Description: https://datasheet.ciiva.com/12667/pyu-rc0402-51-rohs-l-6-r-12667067.pdf?src-supplier=Mouser; ComponentLink6URL: https://datasheet.ciiva.com/7849/1784430-7849813.pdf?src-supplier=Element14; ComponentLink6Description: https://datasheet.ciiva.com/7849/1784430-7849813.pdf?src-supplier=Element14; ComponentLink7URL: https://datasheet.ciiva.com/7849/1784430-7849815.pdf?src-supplier=Element14; ComponentLink7Description: https://datasheet.ciiva.com/7849/1784430-7849815.pdf?src-supplier=Element14; Supplier Part Number 1: 603-RC0402FR-0710KL; LCSC Part Number: C60490
R62 = RC0603JR-070RL: RES 0 OHM JUMPER 1/10W 0603; Manufacturer: Yageo; Resistance: 0mR; Tolerance: 1%; Power Rating: 100mW; Voltage Rating (DC): 50V; Temperature Coefficient: 200ppm/°C; Resistance Tolerance: 5%; Item Type: Resistor; Supplier 1: Digi-Key; Manufacturer Part Number: RC0603JR-070RL; RoHS: Yes; Category: Chip SMD Resistors; Stock 1: 18081776; Pricing 1: 1=0.10000, 10=0.01700, 25=0.01240, 50=0.00960, 100=0.00700, 250=0.00536, 500=0.00430, 1000=0.00316 (USD); Case/Package: 0603; Number of Pins: 2; Contact Plating: Tin,Matte; Case Code (Imperial): 0603; Case Code (Metric): 1608; Size Code: 0603; Min Operating Temperature: -55°C; Max Operating Temperature: 155°C; Resistor Type: Thick Film; Packaging: Tape and Reel; Termination: SMD/SMT; Series: RC; Technology: THICK FILM; Package Quantity: 5000; Voltage Rating: 50V; Features: Moisture Resistant; Max Power Dissipation: 100mW; Number of Terminations: 2; Construction: Rectangular; Length: 1.6mm; Width: 0.8mm; Height: 0.45mm; Depth: 0.8mm; Radiation Hardening: No; Reach SVHC Compliant: No SVHC; Lead Free: Lead Free; RoHS Compliant: Yes; Military Standard: Not; Supplier Part Number 1: 311-0.0GRCT-ND; LCSC Part Number: C95177
R68 = RC0402FR-070RL: RES 0 OHM JUMPER 1/16W 0402; Manufacturer: Yageo; Item Type: Resistors; Tolerance: 1%; Power Rating: 62.5mW; Voltage Rating: 50V; Temperature Coefficient: 200ppm/°C; Max Power Dissipation: 63mW; Supplier 1: Mouser; Manufacturer Part Number: RC0402FR-070RL; RoHS: Yes; Stock 1: 8556842; Pricing 1: 1=0.10000, 10=0.01400, 50=0.01400, 100=0.00600, 1000=0.00300, 5000=0.00200, 10000=0.00100 (USD); Mount: Surface Mount; Case/Package: 0402; Contact Plating: Tin,Matte; Case Code (Imperial): 0402; Case Code (Metric): 1005; Size Code: 0402; Min Operating Temperature: -55°C; Max Operating Temperature: 155°C; Resistance: 0R; Resistor Type: Thick Film; Packaging: Tape and Reel; Termination: SMD/SMT; Features: Moisture Resistant; Series: RC; Number of Terminations: 2; Length: 1mm; Width: 0.5mm; Height: 0.35mm; Radiation Hardening: No; Lead Free: Lead Free; RoHS Compliant: Yes; ComponentLink1URL: https://datasheet.ciiva.com/8896/pyu-rc0402-51-rohs-l-6-8896149.pdf?src-supplier=Avnet; ComponentLink1Description: https://datasheet.ciiva.com/8896/pyu-rc0402-51-rohs-l-6-8896149.pdf?src-supplier=Avnet; ComponentLink2URL: https://datasheet.ciiva.com/16790/pyu-rc0402-51-rohs-l-6-r-16790444.pdf?src-supplier=Future+Electronics; ComponentLink2Description: https://datasheet.ciiva.com/16790/pyu-rc0402-51-rohs-l-6-r-16790444.pdf?src-supplier=Future+Electronics; Supplier Part Number 1: 603-RC0402FR-070RL; LCSC Part Number: C106231
R70 = RC0603FR-0749R9L: RES 49.9 OHM 1% 1/10W 0603; Manufacturer: Yageo; Temperature Coefficient: 100ppm/°C; Voltage Rating (DC): 50V; Power Rating: 100mW; Item Type: Resistor; Supplier 1: Arrow Electronics; Manufacturer Part Number: RC0603FR-0749R9L; RoHS: Yes; Category: Chip SMD Resistors; Stock 1: 2075000; Pricing 1: 5000=0.00280 (USD); Case/Package: 0603; Number of Pins: 2; Case Code (Imperial): 0603; Case Code (Metric): 1608; Size Code: 0603; Min Operating Temperature: -55°C; Max Operating Temperature: 155°C; Tolerance: 1%; Resistance: 49.9R; Resistor Type: Thick Film; Packaging: Tape and Reel; Voltage Rating: 50V; Termination: SMD/SMT; Features: Moisture Resistant; Series: RC; Max Power Dissipation: 100mW; Number of Terminations: 2; Construction: Rectangular; Resistance Tolerance: 1%; Technology: THICK FILM; Length: 1.6mm; Height: 0.45mm; Depth: 0.8mm; Lead Free: Lead Free; REACH SVHC: No SVHC; Military Standard: Not; RoHS Compliant: Yes; ComponentLink1URL: https://datasheet.ciiva.com/11808/0900766b80f96399-11808223.pdf?src-supplier=RSComponents; ComponentLink1Description: https://datasheet.ciiva.com/11808/0900766b80f96399-11808223.pdf?src-supplier=RSComponents; ComponentLink2URL: https://datasheet.ciiva.com/22747/443971-22747527.pdf?src-supplier=Element14; ComponentLink2Description: https://datasheet.ciiva.com/22747/443971-22747527.pdf?src-supplier=Element14; ComponentLink3URL: https://datasheet.ciiva.com/15189/getdatasheetpartid-325421-15189750.pdf?src-supplier=Verical; ComponentLink3Description: https://datasheet.ciiva.com/15189/getdatasheetpartid-325421-15189750.pdf?src-supplier=Verical; Supplier Part Number 1: RC0603FR-0749R9L; LCSC Part Number: C114625
SW5 SW6 = GT-TC032A-H015-L1: None Without bracket 50mA 3.05mm 100000 Times 12V 160gf 2.5mm 1.5mm Round Button Standing paste SPST SMD Tactile Switches ROHS; Manufacturer: G-Switch; Item Type: Switch; Manufacturer Part Number: GT-TC032A-H015-L1; Package: SMD; LCSC Part Number: C843684; ComponentLink1Description: LCSC; ComponentLink1URL: https://www.lcsc.com/product-detail/Tactile-Switches_G-Switch-GT-TC032A-H015-L1_C843684.html?s_z=n_B3U-1000P
TP5 = 0.5mm Test Pad: Test pad
TP6 = 2 Test Pad: Wire Connecting Pad; Item Type: Test Point; Manufacturer Part Number: 2 Test Pad
U9 = ESP32-S3R8: SMD IC ESP32-S3R8, DUAL-CORE MCU; Manufacturer: Espressif Systems; Supplier 1: Mouser; Manufacturer Part Number: ESP32-S3R8; RoHS: No; Category: RF Receivers, Transceivers; Stock 1: 2366; Pricing 1: 1=2.46, 10=2.46, 50=2.46, 100=2.46, 1000=2.46, 10000=2.46 (USD); Supplier Part Number 1: 356-ESP32-S3R8; Item Type: IC
U10 = AW9364DNR: 4-Channel 1-wire Dimming LED Driver with Ultra Low Dropout Current Source; Manufacturer: AWINIC(Shanghai Awinic Tech); Item Type: IC; Manufacturer Part Number: AW9364DNR; Package: DFN-8-EP(2x2); LCSC Part Number: C401007; ComponentLink1Description: LCSC; ComponentLink1URL: https://lcsc.com/product-detail/LED-Drivers_AWINIC-Shanghai-Awinic-Tech-AW9364DNR_C401007.html?s_z=n_AW9364
U11 = W25Q128JVSIQ: IC FLASH 128MBIT SPI/QUAD 8SOIC; Manufacturer: Winbond; Memory Format: Non-Volatile,FLASH; Frequency: 133MHz; Memory Size: 128Mb; Supplier: Arrow Electronics; Supplier Part Number: W25Q128JVSIQ; Manufacturer Part Number: W25Q128JVSIQ; RoHS: Yes; Category: Flash; Stock: 3659; Pricing: 1=1.6411, 10=1.4568, 25=1.4422, 50=1.3009, 100=1.2498, 250=1.2373, 500=1.1781, 1000=1.1392, 5000=1.0957 (USD); Mounting Technology: Surface Mount; Case/Package: SOIC; Min Operating Temperature: -40°C; Max Operating Temperature: 85°C; Packaging: Tray; Series: SpiFlash®; RoHS Compliant: Yes; ComponentLink1URL: http://www.winbond.com/resource-files/w25q128jv%20revf%2003272018%20plus.pdf?src-supplier=Digikey; ComponentLink1Description: http://www.winbond.com/resource-files/w25q128jv%20revf%2003272018%20plus.pdf?src-supplier=Digikey; LCSC Part Number: C97521; Item Type: IC
U12 = XL9535QF24: 16-bit I²C-bus and SMBus I/O port Expander With Interrupt Output and Configuration Registers; Manufacturer: XINLUDA; Item Type: IC; Manufacturer Part Number: XL9535QF24; Package: QFN-24(4x4); LCSC Part Number: C5444301; ComponentLink1Description: LCSC; ComponentLink1URL: https://lcsc.com/product-detail/I-O-Expanders_XINLUDA-XL9535QF24_C5444301.html?s_z=n_XINLUDA%2520XL9535
X1 = X322540MPB4SI: 40MHz SMD Crystal Resonator 15pF SMD3225-4P Crystals ROHS; Manufacturer: Yangxing Tech; Manufacturer Part Number: X322540MPB4SI; Value: 40MHZ; LCSC Part Number: C9010; ComponentLink1Description: LCSC; ComponentLink1URL: https://www.lcsc.com/product-detail/Crystals_Yangxing-Tech-X322540MPB4SI_C9010.html; Item Type: Crystal

## Nets that join several sheets
3V3: Controller-Sheet (24 pins), Power-Sheet (8 pins)
3V3-DIS: Power-Sheet (R20.1 R63.2), Screen-Controller-Sheet (26 pins)
GND: Controller-Sheet (45 pins), Power-Sheet (51 pins), Screen-Controller-Sheet (47 pins)
BATT_ADC: Controller-Sheet (C25.2 D11.2 D12.2 R29.1), Power-Sheet (R40.1 R41.1)
COM_UART_RX: Controller-Sheet (R26.2), Screen-Controller-Sheet (U9.43)
COM_UART_TX: Controller-Sheet (R33.2), Screen-Controller-Sheet (U9.9)
MCU_INT: Controller-Sheet (R49.2 U6.12), Screen-Controller-Sheet (U9.6)
PB_1: Controller-Sheet (R23.1), Power-Sheet (D2.2 R9.1 SW1.1 U4.3)
PB_2: Controller-Sheet (R24.1), Power-Sheet (D3.2 R11.1 SW2.1 U4.6)